# EAGLE design breakbreamRx-v1.0 (EAGLE 9.6.2)
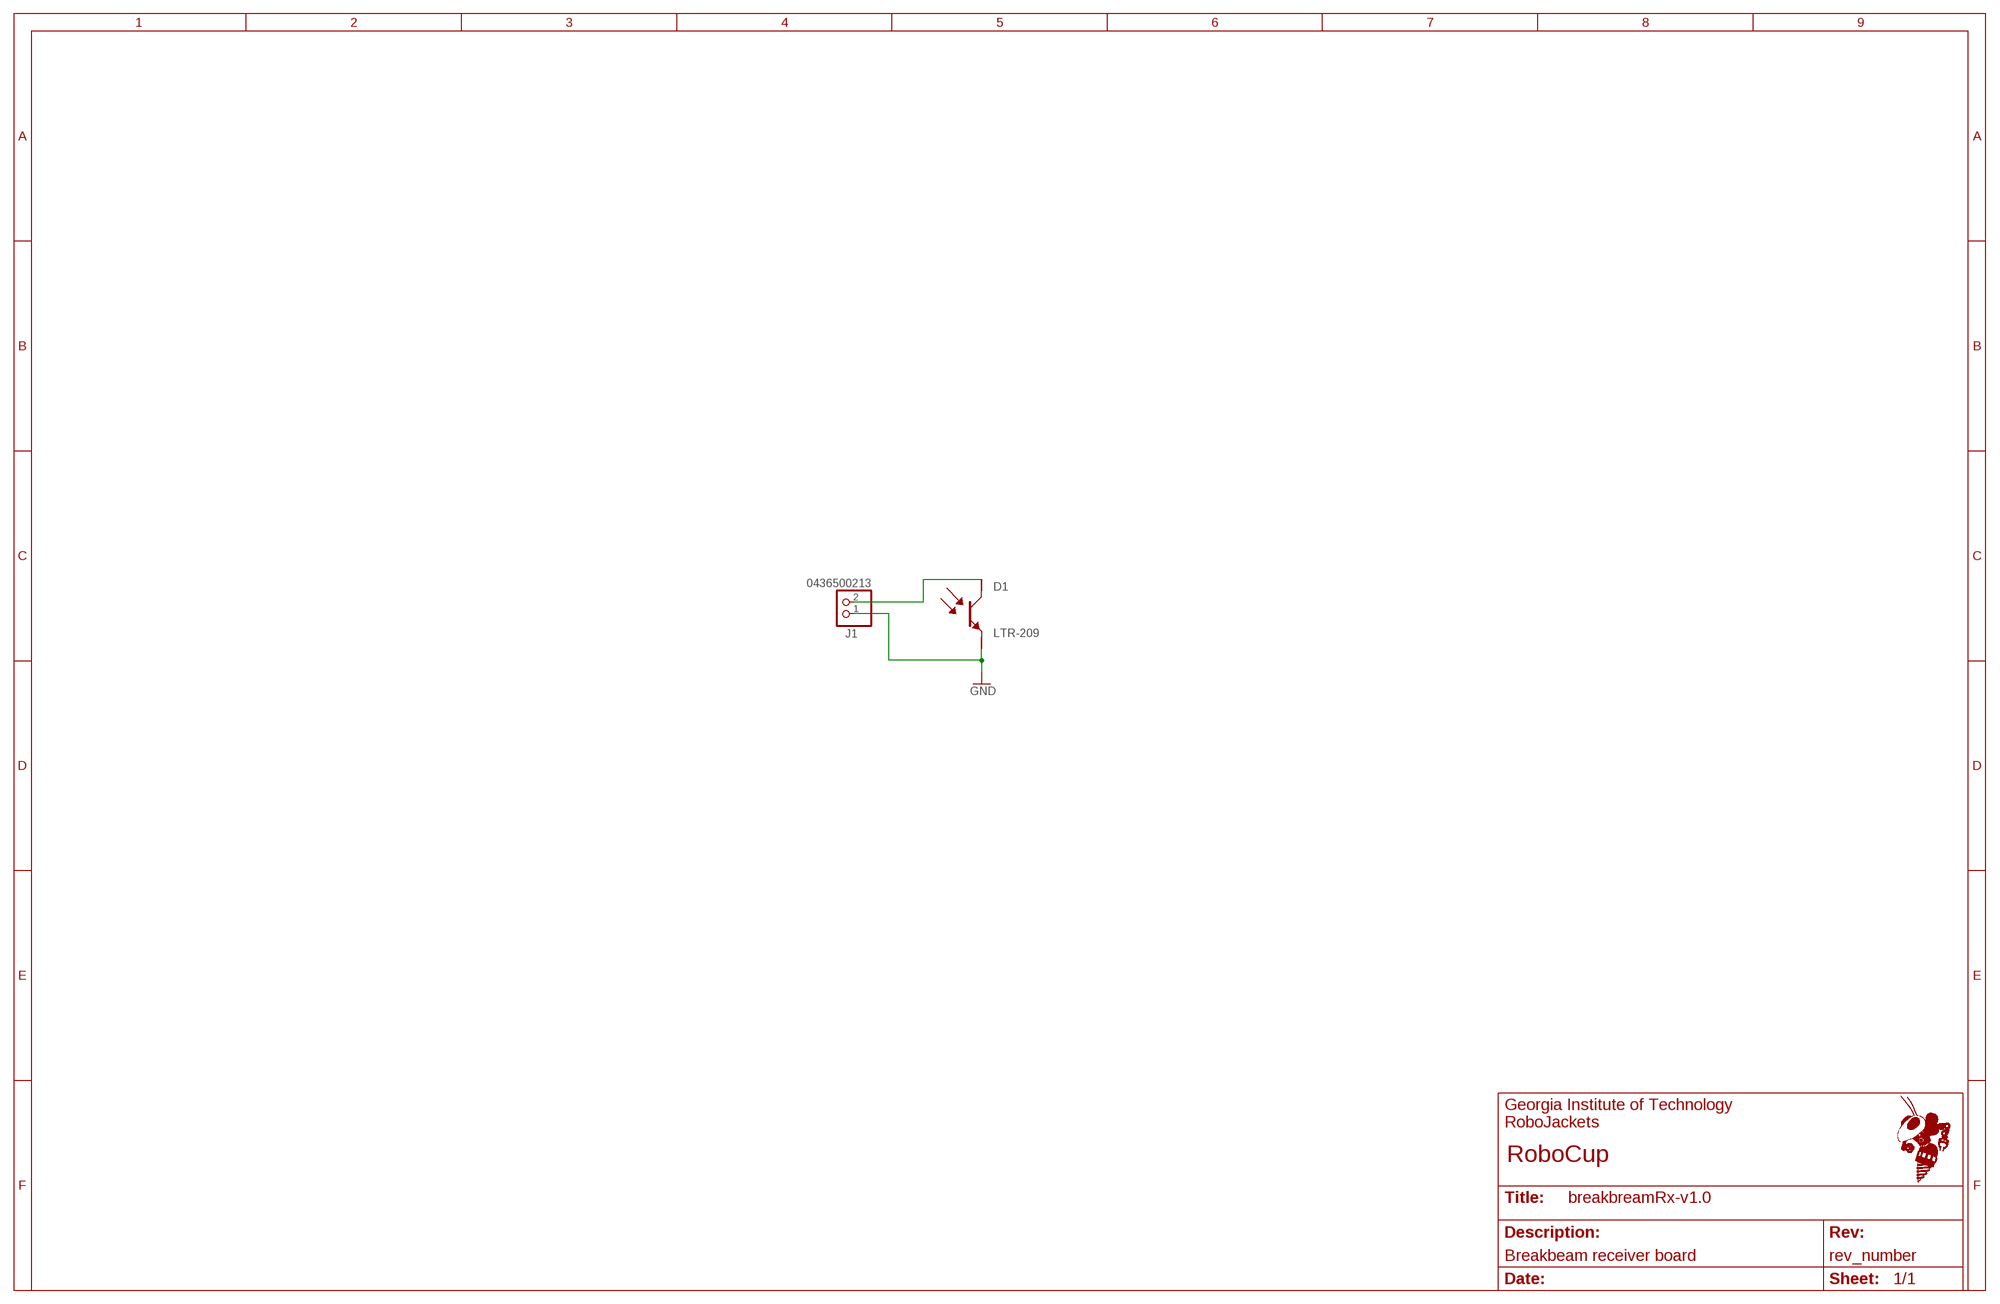
[diagram p0: schematic, sheet 1]
FRAME1 (FRAME_11_17): REVISION: rev_number; SCH_DESC: Breakbeam receiver board; TEAM: RoboCup

## Parts
D1  LTR-209  [LTR-209]
J1  0436500213  [0436500213]

## Nets
GND: D1.GND(C) J1.1
RX: D1.VCC(E) J1.2

## Library data of the parts
D1 = RoboJackets-Discrete:LTR-209
J1 = RoboJackets-Connectors:0436500213

## Board
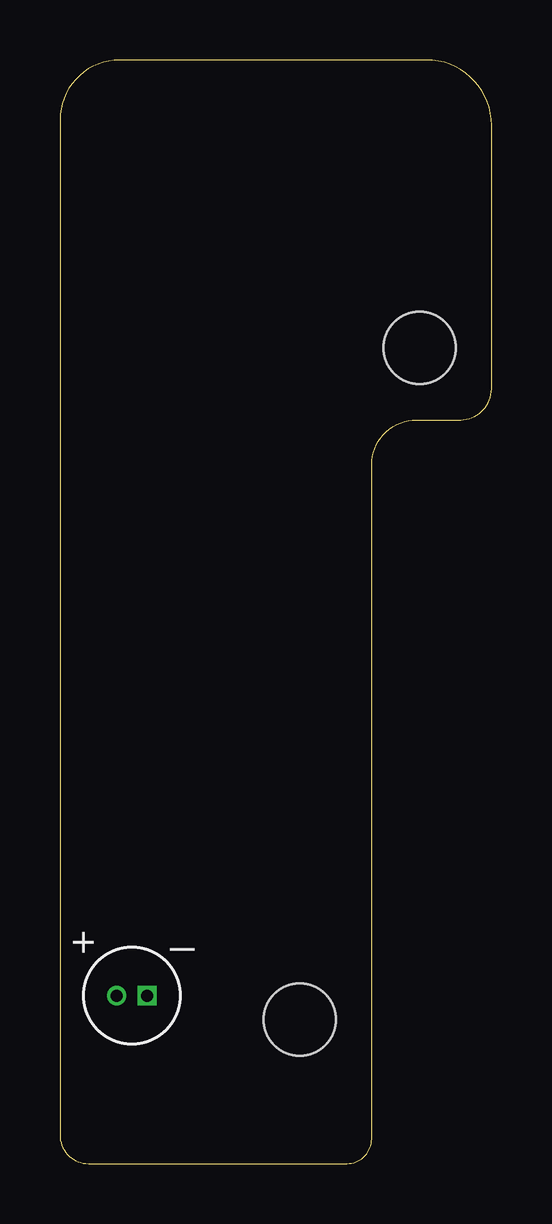
[diagram p1: board, top side]
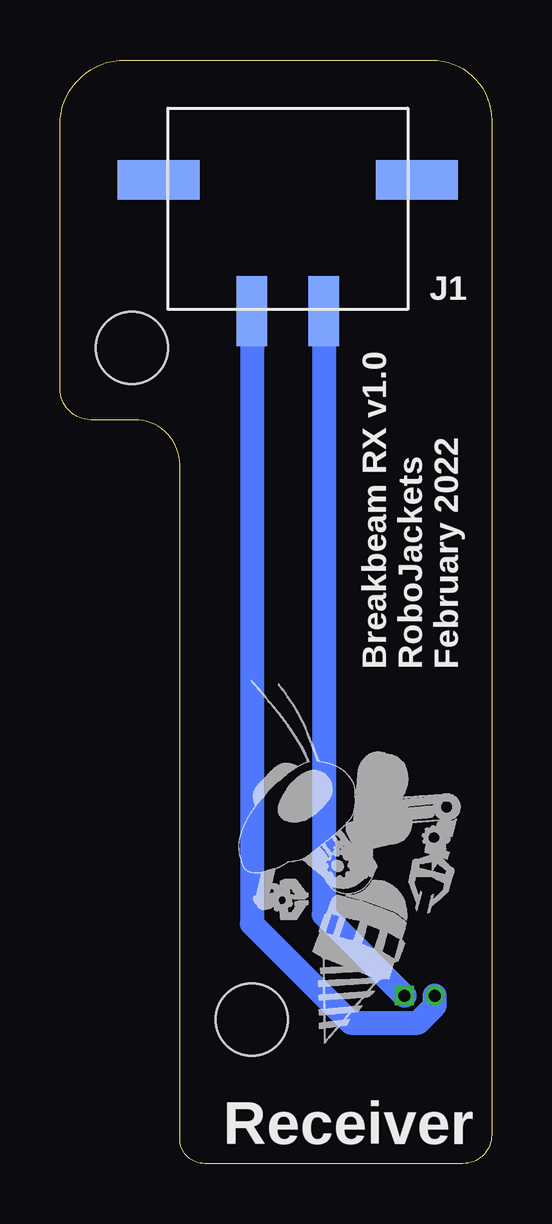
[diagram p2: board, bottom side, seen from below]

Size 18 x 46 mm. Coordinates in mm from the lower left corner, seen from the top.
Outline: 13,1.02 13,29.12 arc-90 14.88,31 16.71,31 arc90 18,32.29 18,43.28 arc90 15.28,46 2.5,46 arc90 0,43.5 0,1.19 arc90 1.19,0 11.98,0 arc90 13,1.02
Copper layers (1+16): Top 0.035mm / dielectric 1.53mm / Bottom 0.035mm
Design rules "JLCPCB (2 Layer)": minimum track width 5mil, minimum drill 0.3mm, track to track 5mil, track to pad 5mil, pad to pad 5mil, via to via 20mil, smd to smd 5mil, copper to edge 0.2mm, drill to drill 21mil, minimum pad ring 6mil, minimum via ring 6mil, stop-mask expansion 2mil, vias tented up to drill 30mil, thermal gap 10mil
Holes 3 mm at 15,34 10,6

### Footprints (pad centres in the part's own frame; a part is rotated, then mirrored left to right if it is on the bottom)
LTR-209 = drill 0.5 square: GND 0.635,0 | drill 0.5: VCC -0.635,0
0436500213 = smd 1.27 x 2.92: 1 -1.5,5.47; 2 1.5,5.47 | smd 3.43 x 1.65: P$1 -5.385,0; P$2 5.385,0

### Placement (x,y rotation side)
D1  3,7 0 top
J1  8.5,41 180 bottom
U$1  [ROBOBUZZ_0.8X]  7,5 0 bottom

### Tracks (layer width: path | path; a pad name or v marks a point on that pad's centre or on a via)
GND
  Bottom 1: D1.GND 7,10.37 J1.1
RX
  Bottom 1: J1.2 10,10 5.87,5.87 3.07,5.87 2.37,6.58 D1.VCC

### Text on the board
tPlace: + | _
bPlace: Breakbeam RX v1.0 / RoboJackets / February 2022 | Receiver
bNames: J1